# Altium schematic sheet Peripherals_Section.SchDoc
size A4; DocumentNumber: 8; SheetNumber: 8; SheetTotal: 8
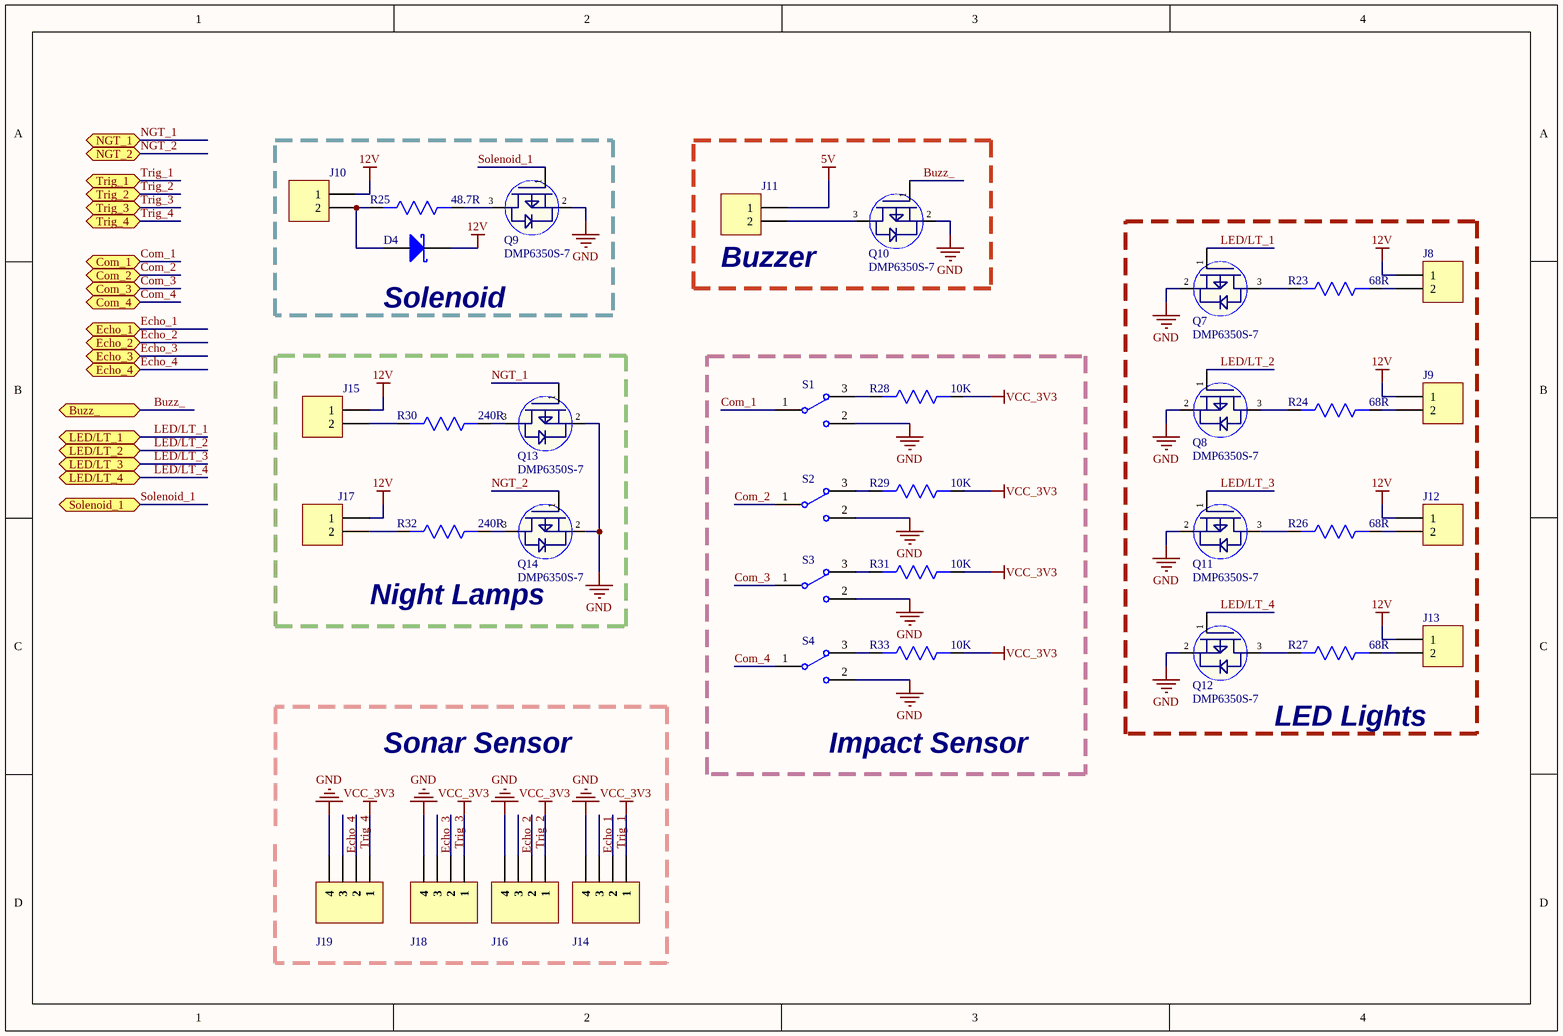
[diagram p0: Peripherals_Section.SchDoc]

## Parts
D4  PMEG3010ER,115  [SOD-123W]  (value not drawn)
J8  B2B-EH-A(LF)(SN)  [B2B-EH-A(LF)(SN)]  (value not drawn)
J9  B2B-EH-A(LF)(SN)  [B2B-EH-A(LF)(SN)]  (value not drawn)
J10  B2B-EH-A(LF)(SN)  [B2B-EH-A(LF)(SN)]  (value not drawn)
J11  B2B-EH-A(LF)(SN)  [B2B-EH-A(LF)(SN)]  (value not drawn)
J12  B2B-EH-A(LF)(SN)  [B2B-EH-A(LF)(SN)]  (value not drawn)
J13  B2B-EH-A(LF)(SN)  [B2B-EH-A(LF)(SN)]  (value not drawn)
J14  A2541HWR-4P  (value not drawn)
J15  B2B-EH-A(LF)(SN)  [B2B-EH-A(LF)(SN)]  (value not drawn)
J16  A2541HWR-4P  (value not drawn)
J17  B2B-EH-A(LF)(SN)  [B2B-EH-A(LF)(SN)]  (value not drawn)
J18  A2541HWR-4P  (value not drawn)
J19  A2541HWR-4P  (value not drawn)
Q7  DMP6350S-7  [SOT23-3]
Q8  DMP6350S-7  [SOT23-3]
Q9  DMP6350S-7  [SOT23-3]
Q10  DMP6350S-7  [SOT23-3]
Q11  DMP6350S-7  [SOT23-3]
Q12  DMP6350S-7  [SOT23-3]
Q13  DMP6350S-7  [SOT23-3]
Q14  DMP6350S-7  [SOT23-3]
R23  68R  [Res0402]
R24  68R  [Res0402]
R25  48.7R  [Res0402]
R26  68R  [Res0402]
R27  68R  [Res0402]
R28  10K  [Res-0201]
R29  10K  [Res-0201]
R30  240R  [Res0402]
R31  10K  [Res-0201]
R32  240R  [Res0402]
R33  10K  [Res-0201]
S1  DC1C-A1AA  [DC1C-A1AA]  (value not drawn)
S2  DC1C-A1AA  [DC1C-A1AA]  (value not drawn)
S3  DC1C-A1AA  [DC1C-A1AA]  (value not drawn)
S4  DC1C-A1AA  [DC1C-A1AA]  (value not drawn)

## Blocks framed on the sheet
Solenoid: D4 J10 Q9 R25
Buzzer: J11 Q10
LED Lights: J8 J9 J12 J13 Q7 Q8 Q11 Q12 R23 R24 R26 R27
Night Lamps: J15 J17 Q13 Q14 R30 R32
Impact Sensor: R28 R29 R31 R33 S1-S4

## Ports
Buzz_ (bidir), Com_1 (bidir), Com_2 (bidir), Com_3 (bidir), Com_4 (bidir), Echo_1 (bidir), Echo_2 (bidir), Echo_3 (bidir), Echo_4 (bidir), LED/LT_1 (bidir), LED/LT_2 (bidir), LED/LT_3 (bidir), LED/LT_4 (bidir), NGT_1 (bidir), NGT_2 (bidir), Solenoid_1 (bidir), Trig_1 (bidir), Trig_2 (bidir), Trig_3 (bidir), Trig_4 (bidir)

## Nets
5V: J11.1
12V: D4.2(K) J8.1 J9.1 J10.1 J12.1 J13.1 J15.1 J17.1
GND: J14.4 J16.4 J18.4 J19.4 Q7.2(S) Q8.2(S) Q9.2(S) Q10.2(S) Q11.2(S) Q12.2(S) Q13.2(S) Q14.2(S) S1.2 S2.2 S3.2 S4.2
VCC_3V3: J14.1 J16.1 J18.1 J19.1 R28.1 R29.1 R31.1 R33.1
Buzz_: Q10.1(G) ; port Buzz_
Com_1: S1.1 ; port Com_1
Com_2: S2.1 ; port Com_2
Com_3: S3.1 ; port Com_3
Com_4: S4.1 ; port Com_4
Echo_1: J14.3 ; port Echo_1
Echo_2: J16.3 ; port Echo_2
Echo_3: J18.3 ; port Echo_3
Echo_4: J19.3 ; port Echo_4
LED/LT_1: Q7.1(G) ; port LED/LT_1
LED/LT_2: Q8.1(G) ; port LED/LT_2
LED/LT_3: Q11.1(G) ; port LED/LT_3
LED/LT_4: Q12.1(G) ; port LED/LT_4
NGT_1: Q13.1(G) ; port NGT_1
NGT_2: Q14.1(G) ; port NGT_2
Solenoid_1: Q9.1(G) ; port Solenoid_1
Trig_1: J14.2 ; port Trig_1
Trig_2: J16.2 ; port Trig_2
Trig_3: J18.2 ; port Trig_3
Trig_4: J19.2 ; port Trig_4
NetD4_1: D4.1(A) J10.2 R25.2
NetJ8_2: J8.2 R23.1
NetJ9_2: J9.2 R24.1
NetJ11_2: J11.2 Q10.3(D)
NetJ12_2: J12.2 R26.1
NetJ13_2: J13.2 R27.1
NetJ15_2: J15.2 R30.2
NetJ17_2: J17.2 R32.2
NetQ7_3: Q7.3(D) R23.2
NetQ8_3: Q8.3(D) R24.2
NetQ9_3: Q9.3(D) R25.1
NetQ11_3: Q11.3(D) R26.2
NetQ12_3: Q12.3(D) R27.2
NetQ13_3: Q13.3(D) R30.1
NetQ14_3: Q14.3(D) R32.1
NetR28_2: R28.2 S1.3
NetR29_2: R29.2 S2.3
NetR31_2: R31.2 S3.3
NetR33_2: R33.2 S4.3

## Notes on the sheet
- Sonar Sensor

## Library data of the parts
D4 = PMEG3010ER,115: DIODE SCHOTTKY 30V 1A SOD123W; Manufacturer: Nexperia; Supplier 1: Digi-Key; Manufacturer Part Number: PMEG3010ER,115; Stock 1: 72983; Pricing 1: 1=0.35, 10=0.282, 25=0.258, 100=0.162, 250=0.1602, 500=0.15, 1000=0.102 (USD); Supplier Part Number 1: 1727-5201-1-ND
J8-J13 J15 J17 = B2B-EH-A(LF)(SN): CONN HEADER VERT 2POS 2.5MM; Manufacturer: JST; Current Rating: 3A; Voltage Rating: 250V; Contact Resistance: 20mR; Number of Positions: 2; Connector Type: Male Pin,Plug; Gender: Male; Supplier 1: Digi-Key; Manufacturer Part Number: B2B-EH-A(LF)(SN); Stock 1: 25023; Pricing 1: 1=0.14, 10=0.131, 100=0.0809, 500=0.06698, 1000=0.05861, 5000=0.05024, 10000=0.04884 (USD); Mount: Through Hole; Contact Material: Copper Alloy,Brass; Color: Natural; Contact Plating: Tin,Copper; Housing Color: White; Housing Material: Nylon; Min Operating Temperature: -25°C; Max Operating Temperature: 85°C; Number of Rows: 1; Fastening Type: Detent; Packaging: Bulk; Max Current Rating: 3A; Termination: Press-Fit; Number of Contacts: 2; Max Voltage Rating (AC): 250V; Orientation: Straight; Length: 7.5mm; Pitch: 2.5mm; Contact Mating Length: 0.13inch; Depth: 3.8mm; Lead Free: Lead Free; ComponentLink1URL: http://uk.rs-online.com/webdocs/05aa/0900766b805aab1f.pdf?src-supplier=RSComponents; ComponentLink1Description: http://uk.rs-online.com/webdocs/05aa/0900766b805aab1f.pdf?src-supplier=RSComponents; ComponentLink2URL: http://www.jst-mfg.com/product/pdf/eng/eEH.pdf?src-supplier=Digi-Key; ComponentLink2Description: http://www.jst-mfg.com/product/pdf/eng/eEH.pdf?src-supplier=Digi-Key; ComponentLink3URL: https://www.verical.com/server-webapp/html/getDatasheet?partID=639961&src-supplier=Verical; ComponentLink3Description: https://www.verical.com/server-webapp/html/getDatasheet?partID=639961&src-supplier=Verical; ComponentLink4URL: http://www1.futureelectronics.com/doc/JST/B2B-EH-A(LF)(SN).pdf?src-supplier=Future+Electronics; ComponentLink4Description: http://www1.futureelectronics.com/doc/JST/B2B-EH-A(LF)(SN).pdf?src-supplier=Future+Electronics; ComponentLink5URL: http://www.produktinfo.conrad.com/datenblaetter/1200000-1299999/001217319-da-01-en-STIFTLEISTE_GERADE_2_POL__RM_25MM.pdf?src-supplier=Conrad; ComponentLink5Description: http://www.produktinfo.conrad.com/datenblaetter/1200000-1299999/001217319-da-01-en-STIFTLEISTE_GERADE_2_POL__RM_25MM.pdf?src-supplier=Conrad; Supplier Part Number 1: 455-1611-ND
J14 J16 J18 J19 = Header R/A 4 Pin: Female Header Female Socket 0.100"(2.54mm) 4 1 P=2.54mm Pin Header & Female Header RoHS; Manufacturer: CJT(Changjiang Connectors); Value: Custom; Manufacturer Part No: A2541HWR-4P; Package: Custom
Q7-Q14 = DMP6350S-7: MOSFET P-CHA 60V 720MW SOT23; Manufacturer: Diodes; Continuous Drain Current (ID): 1.5A; Rds On Max: 350mR; Input Capacitance: 206pF; Supplier 1: Digi-Key; Manufacturer Part Number: DMP6350S-7; Stock 1: 30890; Pricing 1: 1=0.41, 10=0.355, 25=0.3316, 100=0.2463, 500=0.19232, 1000=0.15632 (USD); Mount: Surface Mount; Case/Package: TO-236-3; Min Operating Temperature: -55°C; Max Operating Temperature: 150°C; Packaging: Tape and Reel; Drain to Source Voltage (Vdss): 60V; Max Power Dissipation: 720mW; ComponentLink1URL: http://www.farnell.com/datasheets/2814435.pdf?src-supplier=Newark; ComponentLink1Description: http://www.farnell.com/datasheets/2814435.pdf?src-supplier=Newark; ComponentLink2URL: http://www.farnell.com/datasheets/2814435.pdf?src-supplier=Farnell; ComponentLink2Description: http://www.farnell.com/datasheets/2814435.pdf?src-supplier=Farnell; ComponentLink3URL: https://www.diodes.com/assets/Datasheets/DMP6350S.pdf?src-supplier=Digi-Key; ComponentLink3Description: https://www.diodes.com/assets/Datasheets/DMP6350S.pdf?src-supplier=Digi-Key; ComponentLink4URL: http://www.farnell.com/datasheets/2814435.pdf?src-supplier=Element14; ComponentLink4Description: http://www.farnell.com/datasheets/2814435.pdf?src-supplier=Element14; Supplier Part Number 1: DMP6350S-7DICT-ND
R23 R24 R26 R27 = RC0402FR-0768RL: RES SMD 68 OHM 1% 1/16W 0402; Manufacturer: Yageo; Power Rating: 63mW; Voltage Rating: 50V; Temperature Coefficient: 100ppm/°C; Supplier 1: Digi-Key; Manufacturer Part Number: RC0402FR-0768RL; Stock 1: 456960; Pricing 1: 1=0.1, 10=0.015, 100=0.0062, 1000=0.00278, 2500=0.00242, 5000=0.002 (USD); Case/Package: 0402; Case Code (Metric): 1005; Case Code (Imperial): 0402; Min Operating Temperature: -55°C; Max Operating Temperature: 155°C; Tolerance: 1%; Package Quantity: 1; Resistance: 68R; Packaging: Tape and Reel; Composition: Thick Film; Number of Terminations: 2; Termination: SMD/SMT; Military Standard: Not; Max Power Dissipation: 63mW; Features: Moisture Resistant; Length: 1mm; Height: 0.016inch; Width: 0.02inch; Depth: 0.5mm; REACH SVHC: No SVHC; Lead Free: Lead Free; ComponentLink1URL: http://www.yageo.com/documents/recent/PYu-RC_Group_51_RoHS_L_10.pdf?src-supplier=Digi-Key; ComponentLink1Description: http://www.yageo.com/documents/recent/PYu-RC_Group_51_RoHS_L_10.pdf?src-supplier=Digi-Key; ComponentLink2URL: http://www.yageo.com.tw/exep/pages/download/literatures/PYu-R_INT-thick_7.pdf?src-supplier=Digi-Key; ComponentLink2Description: http://www.yageo.com.tw/exep/pages/download/literatures/PYu-R_INT-thick_7.pdf?src-supplier=Digi-Key; ComponentLink3URL: http://www.mouser.com/ds/2/447/PYu-RC0402_51_RoHS_L_6_r-8721.pdf?src-supplier=Mouser; ComponentLink3Description: http://www.mouser.com/ds/2/447/PYu-RC0402_51_RoHS_L_6_r-8721.pdf?src-supplier=Mouser; ComponentLink4URL: http://www.farnell.com/datasheets/1018594.pdf?src-supplier=Element14; ComponentLink4Description: http://www.farnell.com/datasheets/1018594.pdf?src-supplier=Element14; ComponentLink5URL: https://www.verical.com/server-webapp/html/getDatasheet?partID=325392&src-supplier=Verical; ComponentLink5Description: https://www.verical.com/server-webapp/html/getDatasheet?partID=325392&src-supplier=Verical; Supplier Part Number 1: 311-68.0LRCT-ND
R25 = RC0402FR-0748R7L: RES SMD 48.7 OHM 1% 1/16W 0402
R28 R29 R31 R33 = RC0201JR-0710KL: RES SMD 10K OHM 5% 1/20W 0201; Manufacturer: Yageo; Resistance: 10kR; Temperature Coefficient: 200ppm/°C; Power Rating: 50mW; Voltage Rating: 25V; Supplier 1: Digi-Key; Manufacturer Part Number: RC0201JR-0710KL; Stock 1: 1378070; Pricing 1: 1=0.1, 10=0.028, 100=0.0115, 1000=0.00517, 2500=0.00448, 5000=0.00371 (USD); Case/Package: 0201; Contact Plating: Tin,Matte; Case Code (Imperial): 0201; Case Code (Metric): 0603; Min Operating Temperature: -55°C; Max Operating Temperature: 125°C; Tolerance: 5%; Composition: Thick Film; Packaging: Tape and Reel; Termination: SMD/SMT; Military Standard: Not; Voltage Rating (DC): 25V; Length: 0.6mm; Depth: 0.3mm; Radiation Hardening: No; REACH SVHC: Unknown; Lead Free: Lead Free; ComponentLink1URL: http://www.farnell.com/datasheets/2167052.pdf?src-supplier=Element14; ComponentLink1Description: http://www.farnell.com/datasheets/2167052.pdf?src-supplier=Element14; ComponentLink2URL: http://www.yageo.com/documents/recent/PYu-RC0201_51_RoHS_L_8.pdf?src-supplier=Avnet+Europe; ComponentLink2Description: http://www.yageo.com/documents/recent/PYu-RC0201_51_RoHS_L_8.pdf?src-supplier=Avnet+Europe; ComponentLink3URL: http://www.yageo.com/documents/recent/PYu-RC0201_51_RoHS_L_8.pdf?src-supplier=Avnet; ComponentLink3Description: http://www.yageo.com/documents/recent/PYu-RC0201_51_RoHS_L_8.pdf?src-supplier=Avnet; Supplier Part Number 1: 311-10KNDKR-ND
R30 R32 = ERJ-2RKF2400X: RES SMD 240 OHM 1% 1/10W 0402; Manufacturer: Panasonic; Power Rating: 100mW; Voltage Rating: 50V; Temperature Coefficient: 100ppm/°C; Supplier 1: Digi-Key; Manufacturer Part Number: ERJ-2RKF2400X; Stock 1: 969166; Pricing 1: 1=0.1, 10=0.036, 100=0.0145, 1000=0.00649, 2500=0.00564, 5000=0.00466 (USD); Mount: Surface Mount; Case/Package: 0402; Case Code (Metric): 1005; Case Code (Imperial): 0402; Contact Plating: Tin; Min Operating Temperature: -55°C; Max Operating Temperature: 155°C; Resistance: 240R; Tolerance: 1%; Packaging: Tape and Reel; Package Quantity: 1; Composition: Thick Film; Number of Terminations: 2; Termination: SMD/SMT; Military Standard: Not; Max Power Dissipation: 100mW; Voltage Rating (DC): 50V; Features: Automotive AEC-Q200; Working Voltage: 50V; Length: 1mm; Height: 0.35mm; Width: 0.02inch; Depth: 0.5mm; Radiation Hardening: No; REACH SVHC: No SVHC; Lead Free: Lead Free; ComponentLink1URL: http://www.farnell.com/datasheets/426256.pdf?src-supplier=Element14; ComponentLink1Description: http://www.farnell.com/datasheets/426256.pdf?src-supplier=Element14; ComponentLink2URL: http://industrial.panasonic.com/www-data/pdf/AOA0000/AOA0000CE2.pdf?src-supplier=Avnet; ComponentLink2Description: http://industrial.panasonic.com/www-data/pdf/AOA0000/AOA0000CE2.pdf?src-supplier=Avnet; ComponentLink3URL: http://www.mouser.com/ds/2/315/AOA0000CE2-37512.pdf?src-supplier=Mouser; ComponentLink3Description: http://www.mouser.com/ds/2/315/AOA0000CE2-37512.pdf?src-supplier=Mouser; ComponentLink4URL: http://www.farnell.com/datasheets/1678782.pdf?src-supplier=Element14; ComponentLink4Description: http://www.farnell.com/datasheets/1678782.pdf?src-supplier=Element14; ComponentLink5URL: https://www.alliedelec.com/m/d/623f45ff1957d936ff56d46fd1c28cac.pdf?src-supplier=Allied+Electronics; ComponentLink5Description: https://www.alliedelec.com/m/d/623f45ff1957d936ff56d46fd1c28cac.pdf?src-supplier=Allied+Electronics; ComponentLink6URL: http://industrial.panasonic.com/cdbs/www-data/pdf/RDA0000/AOA0000C304.pdf?src-supplier=Farnell; ComponentLink6Description: http://industrial.panasonic.com/cdbs/www-data/pdf/RDA0000/AOA0000C304.pdf?src-supplier=Farnell; ComponentLink7URL: http://www.farnell.com/datasheets/1911175.pdf?src-supplier=Farnell; ComponentLink7Description: http://www.farnell.com/datasheets/1911175.pdf?src-supplier=Farnell; Supplier Part Number 1: P240LCT-ND
S1-S4 = DC1C-A1AA: SWITCH SNAP ACTION SPDT 5A 125V; Manufacturer: Cherry; Mechanical Life: 1000000Cycles; Actuator Material: Polybutylene; Number of Poles: 1; Operating Force: 1.96N; Max Current Rating: 6A; Max Voltage Rating (AC): 250V; Voltage Rating (DC): 48V; Current Rating: 1A; Electrical Life: 6000Cycles; Contact Current Rating: 10A; Pretravel: 0.04inch; Differential Travel: 0.004inch; Overtravel: 0.025inch; Operating Position: 0.33inch; Switch Function: On-Mom; Ratings: IP67,Waterproof,Dust Tight; Approvals: UL,VDE; Supplier 1: Digi-Key; Manufacturer Part Number: DC1C-A1AA; Stock 1: 26482; Pricing 1: 1=4.87, 10=4.298, 25=4.0112, 50=3.82, 100=3.247, 250=2.96052, 500=2.7695, 1000=2.674, 5000=2.53075 (USD); Mount: Chassis Mount,Surface Mount,Brackets; Case/Package: 125; Contact Material: Copper,Silver; Material: Polyethylene; Color: Black; Contact Plating: Silver; Min Operating Temperature: -40°C; Max Operating Temperature: 120°C; Voltage Rating (AC): 125V; Throw Configuration: SPDT; Max Voltage Rating (DC): 48V; Package Quantity: 1200; Packaging: Bulk; Termination: Solder; Switching Current: 6A; Length: 20mm; Depth: 6.45mm; REACH SVHC: No SVHC; Lead Free: Lead Free; Flammability Rating: UL94 V-0; ComponentLink1URL: https://www.verical.com/server-webapp/html/getDatasheet?partID=244158&src-supplier=Verical; ComponentLink1Description: https://www.verical.com/server-webapp/html/getDatasheet?partID=244158&src-supplier=Verical; ComponentLink2URL: http://www.rapidonline.com/pdf/520203.pdf?src-supplier=Rapid+Electronics; ComponentLink2Description: http://www.rapidonline.com/pdf/520203.pdf?src-supplier=Rapid+Electronics; ComponentLink3URL: http://cherryswitches.com/wp-content/blogs.dir/7/2012/07/subminiature_switch_DC_EN1.pdf?src-supplier=Digi-Key; ComponentLink3Description: http://cherryswitches.com/wp-content/blogs.dir/7/2012/07/subminiature_switch_DC_EN1.pdf?src-supplier=Digi-Key; ComponentLink4URL: http://www.produktinfo.conrad.com/datenblaetter/700000-724999/704435-da-01-ml-SUBMINIATURSCHAL_DC1C_A1AA_6A_250V_de_en.pdf?src-supplier=Conrad; ComponentLink4Description: http://www.produktinfo.conrad.com/datenblaetter/700000-724999/704435-da-01-ml-SUBMINIATURSCHAL_DC1C_A1AA_6A_250V_de_en.pdf?src-supplier=Conrad; Supplier Part Number 1: CH290-ND